# Altium schematic sheet Power.SchDoc
size A3
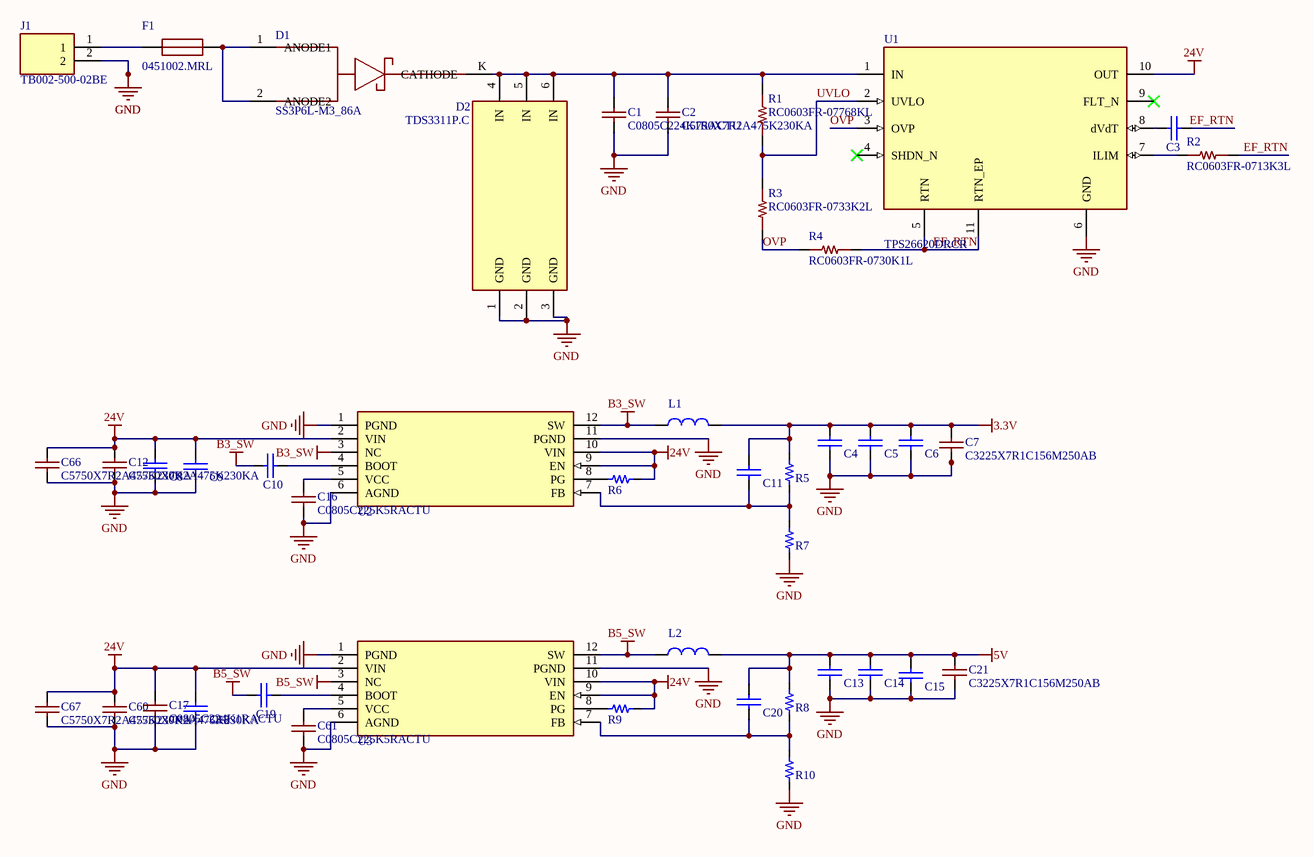
[diagram p0: Power.SchDoc]

## Parts
C1  C0805C224K1RACTU  [GW_0805_KEMET_NOMINAL]
C2  C5750X7R2A475K230KA  [GW_C5750_TDK_REFLOW]
C3  10 nF  [GW_0603_KEMET_NOMINAL]  (value not drawn)
C4  15 uF por unidad; 45 uF nominal banco  [GW_C3225_TDK_REFLOW]  (value not drawn)
C5  15 uF por unidad; 45 uF nominal banco  [GW_C3225_TDK_REFLOW]  (value not drawn)
C6  15 uF por unidad; 45 uF nominal banco  [GW_C3225_TDK_REFLOW]  (value not drawn)
C7  C3225X7R1C156M250AB  [GW_C3225_TDK_REFLOW]
C8  220 nF  [GW_0805_KEMET_NOMINAL]  (value not drawn)
C9  220 nF  [GW_0805_KEMET_NOMINAL]  (value not drawn)
C10  100 nF  [GW_0603_KEMET_NOMINAL]  (value not drawn)
C11  20 pF  [GW_0603_KEMET_NOMINAL]  (value not drawn)
C12  C5750X7R2A475K230KA  [GW_C5750_TDK_REFLOW]
C13  15 uF por unidad; 45 uF nominal banco  [GW_C3225_TDK_REFLOW]  (value not drawn)
C14  15 uF por unidad; 45 uF nominal banco  [GW_C3225_TDK_REFLOW]  (value not drawn)
C15  15 uF por unidad; 45 uF nominal banco  [GW_C3225_TDK_REFLOW]  (value not drawn)
C16  C0805C225K5RACTU  [GW_0805_KEMET_NOMINAL]
C17  C0805C224K1RACTU  [GW_0805_KEMET_NOMINAL]
C18  220 nF  [GW_0805_KEMET_NOMINAL]  (value not drawn)
C19  100 nF  [GW_0603_KEMET_NOMINAL]  (value not drawn)
C20  20 pF  [GW_0603_KEMET_NOMINAL]  (value not drawn)
C21  C3225X7R1C156M250AB  [GW_C3225_TDK_REFLOW]
C60  C5750X7R2A475K230KA  [GW_C5750_TDK_REFLOW]
C61  C0805C225K5RACTU  [GW_0805_KEMET_NOMINAL]
C66  C5750X7R2A475K230KA  [GW_C5750_TDK_REFLOW]
C67  C5750X7R2A475K230KA  [GW_C5750_TDK_REFLOW]
D1  SS3P6L-M3_86A  [GW_SS3P6L_VISHAY_88987]
D2  TDS3311P.C  [GW_TDS3311P_SEMTECH]
F1  0451002.MRL  [GW_0451_LITTELFUSE]
J1  TB002-500-02BE  [GW_TB002_500_2P_SAMESKY]
L1  6.8 uH  [GW_XAL4030_COILCRAFT]  (value not drawn)
L2  10 uH  [GW_XAL4040_COILCRAFT]  (value not drawn)
R1  RC0603FR-07768KL  [GW_RC0603_YAGEO_REFLOW]
R2  RC0603FR-0713K3L  [GW_RC0603_YAGEO_REFLOW]
R3  RC0603FR-0733K2L  [GW_RC0603_YAGEO_REFLOW]
R4  RC0603FR-0730K1L  [GW_RC0603_YAGEO_REFLOW]
R5  100 kOhm  [GW_RC0603_YAGEO_REFLOW]  (value not drawn)
R6  100 kOhm  [GW_RC0603_YAGEO_REFLOW]  (value not drawn)
R7  43.2 kOhm  [GW_RC0603_YAGEO_REFLOW]  (value not drawn)
R8  100 kOhm  [GW_RC0603_YAGEO_REFLOW]  (value not drawn)
R9  100 kOhm  [GW_RC0603_YAGEO_REFLOW]  (value not drawn)
R10  24.9 kOhm  [GW_RC0603_YAGEO_REFLOW]  (value not drawn)
U1  TPS26620DRCR  [GW_DRC0010J_TI_TPS2662_EPU]
U2  LMR36015FBRNXR  [GW_RNX0012A_TI]  (value not drawn)
U3  LMR36015FBRNXR  [GW_RNX0012A_TI]  (value not drawn)

## Nets
3.3V: C4.1 C5.1 C6.1 C7.2 C11.1 L1.2 R5.2
5V: C13.1 C14.1 C15.1 C20.1 C21.2 L2.2 R8.2
24V: C8.1 C9.1 C12.2 C17.2 C18.1 C60.2 C66.2 C67.2 R6.1 R9.1 U1.10(OUT) U2.2(VIN) U2.9(EN) U2.10(VIN) U3.2(VIN) U3.9(EN) U3.10(VIN)
B3_SW: C10.1 L1.1 U2.3(NC) U2.12(SW)
B5_SW: C19.1 L2.1 U3.3(NC) U3.12(SW)
GND: C1.1 C2.1 C4.2 C5.2 C6.2 C7.1 C8.2 C9.2 C12.1 C13.2 C14.2 C15.2 C16.1 C17.1 C18.2 C21.1 C60.1 C61.1 C66.1 C67.1 D2.1(GND) D2.2(GND) D2.3(GND) J1.2 R7.1 R10.1 U1.6(GND) U2.1(PGND) U2.6(AGND) U2.11(PGND) U3.1(PGND) U3.6(AGND) U3.11(PGND)
EF_RTN: C3.1 R2.2 R4.2 U1.5(RTN) U1.11(RTN_EP)
OVP: R3.1 R4.1 U1.3(OVP)
UVLO: R1.1 R3.2 U1.2(UVLO)
NetC1_2: C1.2 C2.2 D1.K(CATHODE) D2.4(IN) D2.5(IN) D2.6(IN) R1.2 U1.1(IN)
NetC3_2: C3.2 U1.8(dVdT)
NetC10_2: C10.2 U2.4(BOOT)
NetC11_2: C11.2 R5.1 R7.2 U2.7(FB)
NetC16_2: C16.2 U2.5(VCC)
NetC19_2: C19.2 U3.4(BOOT)
NetC20_2: C20.2 R8.1 R10.2 U3.7(FB)
NetC61_2: C61.2 U3.5(VCC)
NetD1_1: D1.1(ANODE1) D1.2(ANODE2) F1.2(END2)
NetF1_1: F1.1(END1) J1.1
NetR2_1: R2.1 U1.7(ILIM)
NetR6_2: R6.2 U2.8(PG)
NetR9_2: R9.2 U3.8(PG)

Not connected (* = marked no-connect by the designer): U1 4(SHDN_N)* 9(FLT_N)*

## Library data of the parts
C1 C17 = C0805C224K1RACTU: KEMET exact0805 spec body/termination dimensions; KEMET C1027 p12 Table3 nominal2012 reflow lands transferred to mechanically matching commercial0805; 220nF10%100VX7R;; Design Approval: PROTOTYPE_APPROVED; Electrical Test: NOT_TESTED; CAD Status: CAD_VERIFIED; Limitations: None; Manufacturer: KEMET; Manufacturer Part Number: C0805C224K1RACTU; Value: 220nF10%100VX7R; Source: KEMET exact0805 spec body/termination dimensions, KEMET C1027 p12 Table3 nominal2012 reflow lands transferred to mechanically matching commercial0805
C2 C12 C60 C66 C67 = C5750X7R2A475K230KA: TDK C5750X7R2A475K230KA exact2014web-derived PDF p1 lands,p2 DCbias; current official product page same PA/PB/PC; 4.7uF10%100VX7R;; Design Approval: PROTOTYPE_APPROVED; Electrical Test: NOT_TESTED; CAD Status: CAD_VERIFIED; Limitations: None; Manufacturer: TDK; Manufacturer Part Number: C5750X7R2A475K230KA; Value: 4.7uF10%100VX7R; Source: TDK C5750X7R2A475K230KA exact2014web-derived PDF p1 lands,p2 DCbias, current official product page same PA/PB/PC
C3 = GW_C0603C103K1RACTU_97f3ee33: C0603C103K1RACTU; 10 nF; 100 V; X7R; -55..125 C; CAD_CANDIDATE; Manufacturer: KEMET; Tolerance: 10%; Electrical_Status: PROVISIONAL; CAD_Source: Professor_shared.SchLib glyph Cap_0.1uF_0603_50V; CAD_Limitations: Glyph pins/types inspected; exact manufacturer land-pattern/mask/paste qualification pending.; Electrical_Notes: Ficha KEMET local DI_CIN p1; no confundir con externo CL10B103KA8WPNC 25 V. Modelo candidato existente; sin cotejo visual de pads/pines en Altium.; Manufacturer Part Number: C0603C103K1RACTU; Value: 10 nF; Rating: 100 V; X7R; -55..125 C; Power Rating: N/A; Package: 0603; CAD_Status: CAD_CANDIDATE
C4-C6 C13-C15 = GW_C3225X7R1C156M250AB_bb412b42: C3225X7R1C156M250AB; 15 uF por unidad; 45 uF nominal banco; 16 V; X7R; CAD_CANDIDATE; Manufacturer: TDK; Tolerance: 20%; CAD_Status: CAD_BLOCKED; Electrical_Status: PROVISIONAL; CAD_Source: Professor_shared.SchLib glyph Cap_0.1uF_0603_50V; CAD_Limitations: Symbol only. Exact manufacturer land pattern absent locally; footprint blocked. Ratings copied from provisional BOM, not newly approved.; Electrical_Notes: Ceff a 3.3 V, ESR, escalon de carga y Bode pendientes. No atribuir 45 uF efectivos ni ESR3.04mOhm del modelo AR. Sin footprint1210 docente.; Manufacturer Part Number: C3225X7R1C156M250AB; Value: 15 uF por unidad; 45 uF nominal banco; Rating: 16 V; X7R; Power Rating: N/A; Package: 1210
C7 C21 = C3225X7R1C156M250AB: TDK official C3225X7R1C156M250AB product page lands PA2.0-2.4 PB1.0-1.2 PC1.9-2.5; TI table10-1 rated45uF example; 15uF20%16VX7R; 3 per buck:45uF rated per TI1MHz example. Prototype load-step/ripple confirmation pending; do not connect to24V input.; Design Approval: PROTOTYPE_APPROVED; Electrical Test: NOT_TESTED; CAD Status: CAD_VERIFIED; Limitations: 3 per buck:45uF rated per TI1MHz example. Prototype load-step/ripple confirmation pending, do not connect to24V input.; Manufacturer: TDK; Manufacturer Part Number: C3225X7R1C156M250AB; Value: 15uF20%16VX7R; Source: TDK official C3225X7R1C156M250AB product page lands PA2.0-2.4 PB1.0-1.2 PC1.9-2.5, TI table10-1 rated45uF example
C8 C9 C18 = GW_C0805C224K1RACTU_e16e52b8: C0805C224K1RACTU; 220 nF; 100 V; X7R; CAD_CANDIDATE; Manufacturer: KEMET; Tolerance: 10%; Electrical_Status: PROVISIONAL; CAD_Source: Professor_shared.SchLib glyph Cap_10uF_0805_25V_; CAD_Limitations: Glyph pins/types inspected; exact manufacturer land-pattern/mask/paste qualification pending.; Electrical_Notes: Uno por par VIN-PGND en lados opuestos; falta Ceff y cotejo dimensiones pads. Modelo candidato existente; sin cotejo visual de pads/pines en Altium.; Manufacturer Part Number: C0805C224K1RACTU; Value: 220 nF; Rating: 100 V; X7R; Power Rating: N/A; Package: 0805; CAD_Status: CAD_CANDIDATE
C10 C19 = GW_C0603C104K5RACTU_dc5e12a5: C0603C104K5RACTU; 100 nF; 50 V; X7R; -55..125 C; CAD_CANDIDATE; Manufacturer: KEMET; Tolerance: 10%; Electrical_Status: PROVISIONAL; CAD_Source: Professor_shared.SchLib glyph Cap_0.1uF_0603_50V; CAD_Limitations: Glyph pins/types inspected; exact manufacturer land-pattern/mask/paste qualification pending.; Electrical_Notes: Ficha KEMET local p1. Adaptar parametros; no usar el Y5V 0603F104Z500CT como equivalente. Modelo candidato existente; sin cotejo visual de pads/pines en Altium.; Manufacturer Part Number: C0603C104K5RACTU; Value: 100 nF; Rating: 50 V; X7R; -55..125 C; Power Rating: N/A; Package: 0603; CAD_Status: CAD_CANDIDATE
C11 C20 = GW_C0603C200J5GACTU_c75b007a: C0603C200J5GACTU; 20 pF; 50 V; C0G; CAD_CANDIDATE; Manufacturer: KEMET; Tolerance: 5%; Electrical_Status: PROVISIONAL; CAD_Source: Professor_shared.SchLib glyph Cap_0.1uF_0603_50V; CAD_Limitations: Glyph pins/types inspected; exact manufacturer land-pattern/mask/paste qualification pending.; Electrical_Notes: Valor guia fabricante; validar lazo. Con RFBT100k no obligatorio universal; reservar DNP hasta respuesta/Bode. Modelo candidato existente; sin cotejo visual de pads/pines en Altium.; Manufacturer Part Number: C0603C200J5GACTU; Value: 20 pF; Rating: 50 V; C0G; Power Rating: N/A; Package: 0603; CAD_Status: CAD_CANDIDATE
C16 C61 = C0805C225K5RACTU: KEMET exact0805 spec body/termination dimensions; KEMET C1027 p12 Table3 nominal2012 reflow lands transferred to mechanically matching commercial0805; 2.2uF10%50VX7R; VCC5V local bypass;2.2uF prototype selection replaces known insufficient1uF part. Assumed>=60% bias retention; verify stableVCC at bring-up.; Design Approval: PROTOTYPE_APPROVED; Electrical Test: NOT_TESTED; CAD Status: CAD_VERIFIED; Limitations: VCC5V local bypass,2.2uF prototype selection replaces known insufficient1uF part. Assumed>=60% bias retention, verify stableVCC at bring-up.; Manufacturer: KEMET; Manufacturer Part Number: C0805C225K5RACTU; Value: 2.2uF10%50VX7R; Source: KEMET exact0805 spec body/termination dimensions, KEMET C1027 p12 Table3 nominal2012 reflow lands transferred to mechanically matching commercial0805
D1 = SS3P6L-M3_86A: User-approved series reverse diode:manufacturer1/2 anodes,K large cathode. Same model also reserved DNP output clamp; do not populateSOUT withoutVF review. No hot reverse while charged.; Manufacturer: Vishay; Manufacturer Part Number: SS3P6L-M3/86A; CAD Status: CAD_VERIFIED; Electrical Approval: PROTOTYPE_APPROVED; Limitations: User-approved series reverse diode:manufacturer1/2 anodes,K large cathode. Same model also reserved DNP output clamp, do not populateSOUT withoutVF review. No hot reverse while charged.; Electrical Test: NOT_TESTED; Source: Vishay88987 Rev24-Apr-2020 pp1,4, numbered anodes1/2, cathodeK, minimum mounting lands; Datasheet: sources/SS3P6L_88987.pdf; Design Approval: PROTOTYPE_APPROVED
D2 = TDS3311P.C: Semtech TDS3311P Rev2.4 pp2,7-9; official product portal confirms33V orderTDS3311P.C; 33V working;42Vmax specified35A pulse;; Design Approval: PROTOTYPE_APPROVED; Electrical Test: NOT_TESTED; CAD Status: CAD_VERIFIED; Limitations: None; Manufacturer: Semtech; Manufacturer Part Number: TDS3311P.C; Value: 33V working;42Vmax specified35A pulse; Source: Semtech TDS3311P Rev2.4 pp2,7-9; official product portal confirms33V orderTDS3311P.C
F1 = 0451002.MRL: User-approved2A125VDC fuse; manufacturer dimensioned native footprint linked. Nonpolar terminals project1/2; supervised current-limited lab source. Not electrically tested.; Manufacturer: Littelfuse; CAD Status: CAD_VERIFIED; Electrical Approval: PROTOTYPE_APPROVED; Electrical Test: NOT_TESTED; Manufacturer Part Number: 0451002.MRL; Source: Official451/453 series Rev01-Dec-2025 pp1-4; electrical row002 and ordering; Datasheet: https://www.littelfuse.com/assetdocs/fuse-451-and-453-datasheet?assetguid=533cd5cc-956c-4243-867f-6ab5a62f6ba1; Limitations: User-approved2A125VDC fuse; manufacturer dimensioned native footprint linked. Nonpolar terminals project1/2; supervised current-limited lab source. Not electrically tested.; Design Approval: PROTOTYPE_APPROVED
J1 = TB002-500-02BE: 2~24 Poles, Screw Type, Horizontal, 5.0 Pitch, 22~12 (AWG), Terminal Block Connector; Manufacturer: Same Sky (Formerly CUI Devices); MF: Same Sky; SnapEDA_Link: https://www.snapeda.com/parts/TB002-500-02BE/Same+Sky/view-part/?ref=snap; Package: None; Value: *; MP: TB002-500-02BE; Check_prices: https://www.snapeda.com/parts/TB002-500-02BE/Same+Sky/view-part/?ref=eda; Manufacturer Part Number: TB002-500-02BE
L1 = GW_XAL4030-682MEC_71dfd711: XAL4030-682MEC; 6.8 uH; Isat25C 3.6 A; Irms20C 3.0 A; CAD_CANDIDATE; Manufacturer: Coilcraft; Tolerance: 20%; CAD_Status: CAD_BLOCKED; Electrical_Status: PROVISIONAL; CAD_Source: Professor_shared.SchLib glyph Inductor_10uH_4A_7.2*6.6mm; CAD_Limitations: Symbol only. Exact manufacturer land pattern absent locally; footprint blocked. Ratings copied from provisional BOM, not newly approved.; Electrical_Notes: DCRmax25C 74.1 mOhm. Isat es caida30% tipica; falta derating caliente/curva L(I)/perdidas nucleo y CAD. No usar inductor docente sin Isat verificable.; Manufacturer Part Number: XAL4030-682MEC; Value: 6.8 uH; Rating: Isat25C 3.6 A; Irms20C 3.0 A; Power Rating: N/A; Package: XAL4030
L2 = GW_XAL4040-103MEC_b36cb917: XAL4040-103MEC; 10 uH; Isat25C 3.0 A; Irms20C 2.2 A; CAD_CANDIDATE; Manufacturer: Coilcraft; Tolerance: 20%; CAD_Status: CAD_BLOCKED; Electrical_Status: PROVISIONAL; CAD_Source: Professor_shared.SchLib glyph Inductor_10uH_4A_7.2*6.6mm; CAD_Limitations: Symbol only. Exact manufacturer land pattern absent locally; footprint blocked. Ratings copied from provisional BOM, not newly approved.; Electrical_Notes: DCRmax25C 92.4 mOhm. Isat es caida30% tipica; falta derating caliente/curva L(I)/perdidas nucleo y CAD. No usar inductor docente sin Isat verificable.; Manufacturer Part Number: XAL4040-103MEC; Value: 10 uH; Rating: Isat25C 3.0 A; Irms20C 2.2 A; Power Rating: N/A; Package: XAL4040
R1 = RC0603FR-07768KL: 768kOhm1%0.1W75V; Exact Yageo spec; manufacturer Mounting2018p4Fig4/Table1; Design Approval: PROPOSED_APPLICATION_VALUE; CAD Status: CAD_VERIFIED; Electrical Test: NOT_TESTED; Manufacturer: Yageo; Manufacturer Part Number: RC0603FR-07768KL; Value: 768kOhm1%0.1W75V; Source: Exact Yageo spec, manufacturer Mounting2018p4Fig4/Table1; Datasheet: https://yageogroup.com/download/specsheet/RC0603FR-07768KL
R2 = RC0603FR-0713K3L: 13.3kOhm1%0.1W75V; Exact Yageo spec; manufacturer Mounting2018p4Fig4/Table1; Design Approval: PROPOSED_APPLICATION_VALUE; CAD Status: CAD_VERIFIED; Electrical Test: NOT_TESTED; Manufacturer: Yageo; Manufacturer Part Number: RC0603FR-0713K3L; Value: 13.3kOhm1%0.1W75V; Source: Exact Yageo spec, manufacturer Mounting2018p4Fig4/Table1; Datasheet: https://yageogroup.com/download/specsheet/RC0603FR-0713K3L
R3 = RC0603FR-0733K2L: 33.2kOhm1%0.1W75V; Exact Yageo spec; manufacturer Mounting2018p4Fig4/Table1; Design Approval: PROPOSED_APPLICATION_VALUE; CAD Status: CAD_VERIFIED; Electrical Test: NOT_TESTED; Manufacturer: Yageo; Manufacturer Part Number: RC0603FR-0733K2L; Value: 33.2kOhm1%0.1W75V; Source: Exact Yageo spec, manufacturer Mounting2018p4Fig4/Table1; Datasheet: https://yageogroup.com/download/specsheet/RC0603FR-0733K2L
R4 = RC0603FR-0730K1L: 30.1kOhm1%0.1W75V; Exact Yageo spec; manufacturer Mounting2018p4Fig4/Table1; Design Approval: PROPOSED_APPLICATION_VALUE; CAD Status: CAD_VERIFIED; Electrical Test: NOT_TESTED; Manufacturer: Yageo; Manufacturer Part Number: RC0603FR-0730K1L; Value: 30.1kOhm1%0.1W75V; Source: Exact Yageo spec, manufacturer Mounting2018p4Fig4/Table1; Datasheet: https://yageogroup.com/download/specsheet/RC0603FR-0730K1L
R5 R6 R8 R9 = GW_RC0603FR-07100KL_ac663db8: RC0603FR-07100KL; 100 kOhm; 75 V max; limite sqrt(P*R); CAD_CANDIDATE; Manufacturer: Yageo; Tolerance: 1%; Power Rating: 0.1 W @70 C; Electrical_Status: PROVISIONAL; CAD_Source: Professor_shared.SchLib glyph Res_10k_0603_1/10W; CAD_Limitations: Glyph pins/types inspected; exact manufacturer land-pattern/mask/paste qualification pending.; Electrical_Notes: Vout nominal calculado 3.31481 V; ver esquinas de tolerancia. Cambiar parametros en copia docente. Modelo candidato existente; sin cotejo visual de pads/pines en Altium.; Manufacturer Part Number: RC0603FR-07100KL; Value: 100 kOhm; Rating: 75 V max; limite sqrt(P*R); Package: 0603; CAD_Status: CAD_CANDIDATE
R7 = GW_RC0603FR-0743K2L_a8308c0c: RC0603FR-0743K2L; 43.2 kOhm; 75 V max; limite sqrt(P*R); CAD_CANDIDATE; Manufacturer: Yageo; Tolerance: 1%; Power Rating: 0.1 W @70 C; Electrical_Status: PROVISIONAL; CAD_Source: Professor_shared.SchLib glyph Res_10k_0603_1/10W; CAD_Limitations: Glyph pins/types inspected; exact manufacturer land-pattern/mask/paste qualification pending.; Electrical_Notes: Vout nominal calculado 3.31481 V; ver esquinas de tolerancia. Cambiar parametros en copia docente. Modelo candidato existente; sin cotejo visual de pads/pines en Altium.; Manufacturer Part Number: RC0603FR-0743K2L; Value: 43.2 kOhm; Rating: 75 V max; limite sqrt(P*R); Package: 0603; CAD_Status: CAD_CANDIDATE
R10 = GW_RC0603FR-0724K9L_10698e9e: RC0603FR-0724K9L; 24.9 kOhm; 75 V max; limite sqrt(P*R); CAD_CANDIDATE; Manufacturer: Yageo; Tolerance: 1%; Power Rating: 0.1 W @70 C; Electrical_Status: PROVISIONAL; CAD_Source: Professor_shared.SchLib glyph Res_10k_0603_1/10W; CAD_Limitations: Glyph pins/types inspected; exact manufacturer land-pattern/mask/paste qualification pending.; Electrical_Notes: Vout nominal calculado 5.01606 V; ver esquinas de tolerancia. Cambiar parametros en copia docente. Modelo candidato existente; sin cotejo visual de pads/pines en Altium.; Manufacturer Part Number: RC0603FR-0724K9L; Value: 24.9 kOhm; Rating: 75 V max; limite sqrt(P*R); Package: 0603; CAD_Status: CAD_CANDIDATE
U1 = TPS26620DRCR: Single-channel60V eFuse; TPS26620 latch-off; RTN != system GND; DRC10+EP11; Manufacturer: Texas Instruments; Local Datasheet: sources/tps26620/tps2662.pdf; CAD Status: CAD_CANDIDATE; Design Approval: APPROVED_COMPONENT_SELECTION; Electrical Test: NOT_TESTED; Critical Connection: Pin5 and EP11 to EF_RTN, NEVER directly to system GND pin6; Fault Response: TPS26620 latch-off, adjustable overvoltage cutoff, not TPS26621 auto-retry; Manufacturer Part Number: TPS26620DRCR; Datasheet: https://www.ti.com/lit/ds/symlink/tps2662.pdf; Source: TI TPS2662 SLVSDT4F Dec2021 Table6-1 p4, DRC0010J4218878/B board p44/stencil p45; Footprint Limitation: Native custom-pad11 extension conversion/net inheritance pending, not PCB-release ready
U2 U3 = LMR36015FBRNXR: LMR36015FBRNXR; CAD_CANDIDATE; CAD_CANDIDATE: confirm delivered RNX revision A/B. NC3 is externally connected to SW per TI. RNX12 is SW, not a ground exposed pad. Two footprint variants retained.; Manufacturer: Texas Instruments; Electrical_Status: PROVISIONAL; CAD_Source: SNVSB49D p4; RNX0012A 4222858/A PDF pp44-46 and RNX0012B 4223969/C pp47-49; Manufacturer Part Number: LMR36015FBRNXR; Value: LMR36015FBRNXR; CAD_Status: CAD_CANDIDATE; CAD_Limitations: CAD_CANDIDATE: confirm delivered RNX revision A/B. NC3 is externally connected to SW per TI. RNX12 is SW, not a ground exposed pad. Two footprint variants retained.